# Altium schematic sheet UsFrontEnd.SchDoc
size A3
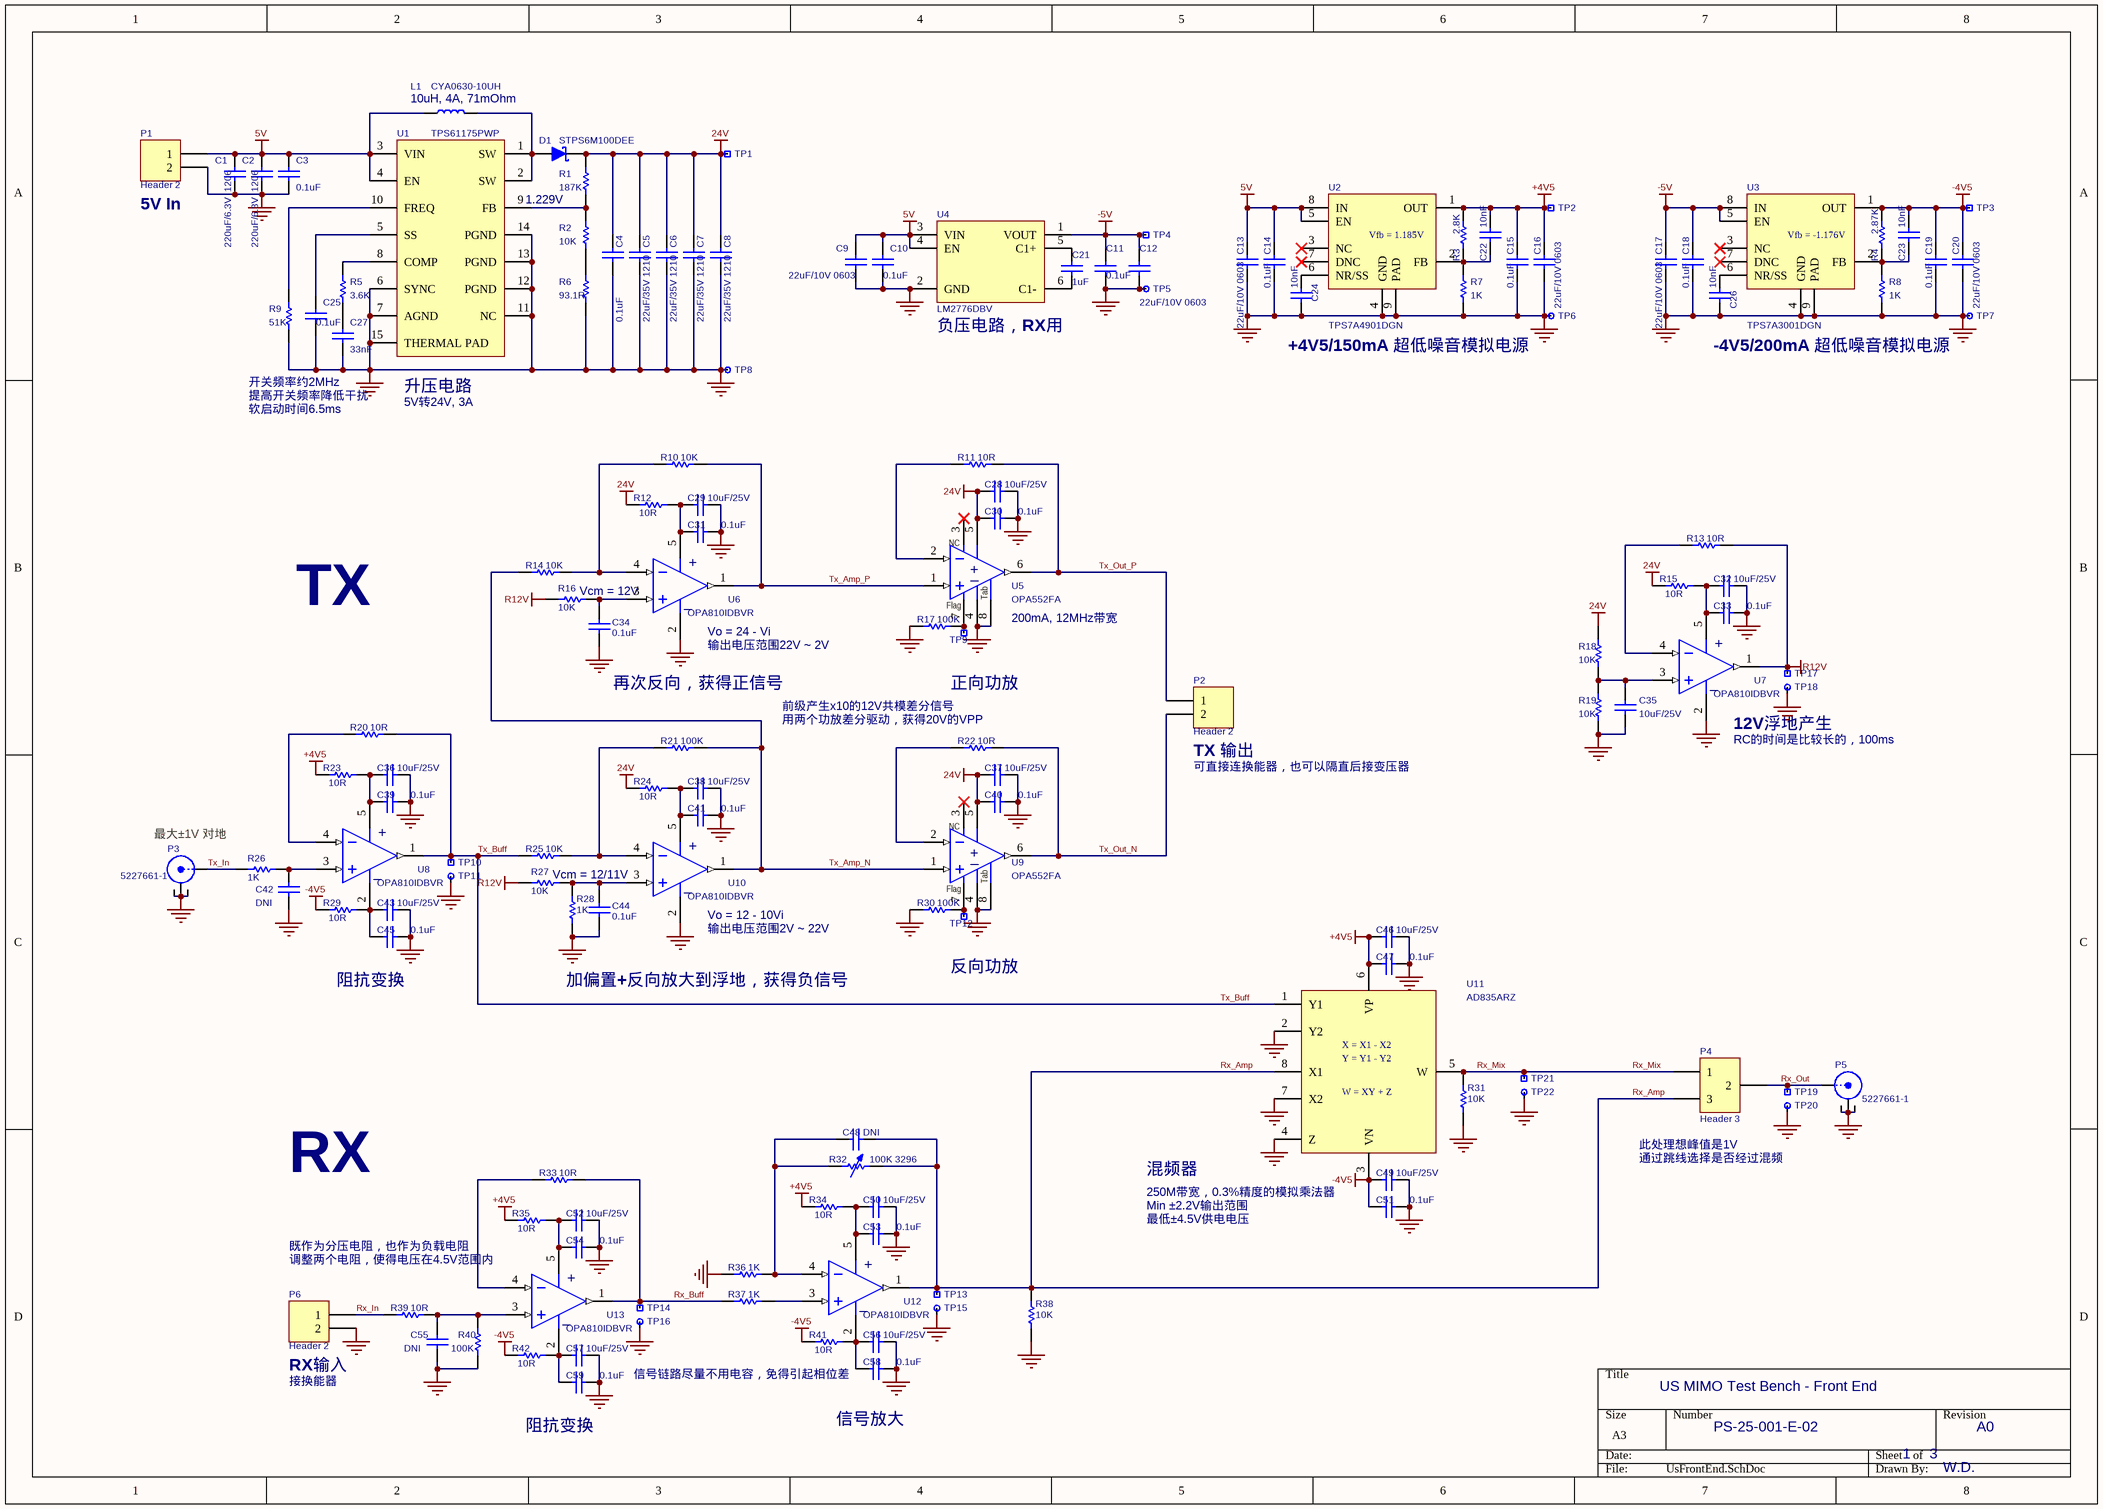
[diagram p0: UsFrontEnd.SchDoc]

## Parts
C1  220uF/6.3V  1206  [1206CAP]
C2  220uF/6.3V  1206  [1206CAP]
C3  0.1uF  [1608[0603]CAP]
C4  0.1uF  [1608[0603]CAP]
C5  22uF/35V 1210  [1210CAP]
C6  22uF/35V 1210  [1210CAP]
C7  22uF/35V 1210  [1210CAP]
C8  22uF/35V 1210  [1210CAP]
C9  22uF/10V 0603  [1608[0603]CAP]
C10  0.1uF  [1005[0402]CAP]
C11  0.1uF  [1005[0402]CAP]
C12  22uF/10V 0603  [1608[0603]CAP]
C13  22uF/10V 0603  [1608[0603]CAP]
C14  0.1uF  [1005[0402]CAP]
C15  0.1uF  [1005[0402]CAP]
C16  22uF/10V 0603  [1608[0603]CAP]
C17  22uF/10V 0603  [1608[0603]CAP]
C18  0.1uF  [1005[0402]CAP]
C19  0.1uF  [1005[0402]CAP]
C20  22uF/10V 0603  [1608[0603]CAP]
C21  1uF  [1005[0402]CAP]
C22  10nF  [1005[0402]CAP]
C23  10nF  [1005[0402]CAP]
C24  10nF  [1005[0402]CAP]
C25  0.1uF  [1608[0603]CAP]
C26  10nF  [1005[0402]CAP]
C27  33nF  [1608[0603]CAP]
C28  10uF/25V  [1608[0603]CAP]
C29  10uF/25V  [1608[0603]CAP]
C30  0.1uF  [1608[0603]CAP]
C31  0.1uF  [1608[0603]CAP]
C32  10uF/25V  [1608[0603]CAP]
C33  0.1uF  [1608[0603]CAP]
C34  0.1uF  [1608[0603]CAP]
C35  10uF/25V  [1608[0603]CAP]
C36  10uF/25V  [1608[0603]CAP]
C37  10uF/25V  [1608[0603]CAP]
C38  10uF/25V  [1608[0603]CAP]
C39  0.1uF  [1608[0603]CAP]
C40  0.1uF  [1608[0603]CAP]
C41  0.1uF  [1608[0603]CAP]
C42  DNI  [1608[0603]CAP]
C43  10uF/25V  [1608[0603]CAP]
C44  0.1uF  [1608[0603]CAP]
C45  0.1uF  [1608[0603]CAP]
C46  10uF/25V  [1608[0603]CAP]
C47  0.1uF  [1608[0603]CAP]
C48  DNI  [1608[0603]CAP]
C49  10uF/25V  [1608[0603]CAP]
C50  10uF/25V  [1608[0603]CAP]
C51  0.1uF  [1608[0603]CAP]
C52  10uF/25V  [1608[0603]CAP]
C53  0.1uF  [1608[0603]CAP]
C54  0.1uF  [1608[0603]CAP]
C55  DNI  [1608[0603]CAP]
C56  10uF/25V  [1608[0603]CAP]
C57  10uF/25V  [1608[0603]CAP]
C58  0.1uF  [1608[0603]CAP]
C59  0.1uF  [1608[0603]CAP]
D1  STPS6M100DEE  [STPS6M100DEE]
L1  CYA0630-10UH  [L6.6X7.2]
P1  Header 2  [KEF2510_2P]
P2  Header 2  [USTR_16MM_H]
P3  5227661-1  [BNC_5227661-1]
P4  Header 3  [HDR1X3]
P5  5227661-1  [BNC_5227661-1]
P6  Header 2  [USTR_16MM_H]
R1  187K  [1608[0603]RES]
R2  10K  [1608[0603]RES]
R3  2.8K  [1005[0402]RES]
R4  2.87K  [1005[0402]RES]
R5  3.6K  [1608[0603]RES]
R6  93.1R  [1608[0603]RES]
R7  1K  [1005[0402]RES]
R8  1K  [1005[0402]RES]
R9  51K  [1608[0603]RES]
R10  10K  [1608[0603]RES]
R11  10R  [1608[0603]RES]
R12  10R  [1608[0603]RES]
R13  10R  [1608[0603]RES]
R14  10K  [1608[0603]RES]
R15  10R  [1608[0603]RES]
R16  10K  [1608[0603]RES]
R17  100K  [1608[0603]RES]
R18  10K  [1608[0603]RES]
R19  10K  [1608[0603]RES]
R20  10R  [1608[0603]RES]
R21  100K  [1608[0603]RES]
R22  10R  [1608[0603]RES]
R23  10R  [1608[0603]RES]
R24  10R  [1608[0603]RES]
R25  10K  [1608[0603]RES]
R26  1K  [1608[0603]RES]
R27  10K  [1608[0603]RES]
R28  1K  [1608[0603]RES]
R29  10R  [1608[0603]RES]
R30  100K  [1608[0603]RES]
R31  10K  [1608[0603]RES]
R32  100K 3296  [3296]
R33  10R  [1608[0603]RES]
R34  10R  [1608[0603]RES]
R35  10R  [1608[0603]RES]
R36  1K  [1608[0603]RES]
R37  1K  [1608[0603]RES]
R38  10K  [1608[0603]RES]
R39  10R  [1608[0603]RES]
R40  100K  [1608[0603]RES]
R41  10R  [1608[0603]RES]
R42  10R  [1608[0603]RES]
TP1  TP_P  [tpad_020_REC]  (value not drawn)
TP2  TP_P  [tpad_020_REC]  (value not drawn)
TP3  TP_P  [tpad_020_REC]  (value not drawn)
TP4  TP_P  [tpad_020_REC]  (value not drawn)
TP5  TP_N  [tpad_020]  (value not drawn)
TP6  TP_N  [tpad_020]  (value not drawn)
TP7  TP_N  [tpad_020]  (value not drawn)
TP8  TP_N  [tpad_020]  (value not drawn)
TP9  TP_P  [tpad_020_REC]  (value not drawn)
TP10  TP_P  [tpad_020_REC]  (value not drawn)
TP11  TP_N  [tpad_020]  (value not drawn)
TP12  TP_P  [tpad_020_REC]  (value not drawn)
TP13  TP_P  [tpad_020_REC]  (value not drawn)
TP14  TP_P  [tpad_020_REC]  (value not drawn)
TP15  TP_N  [tpad_020]  (value not drawn)
TP16  TP_N  [tpad_020]  (value not drawn)
TP17  TP_P  [tpad_020_REC]  (value not drawn)
TP18  TP_N  [tpad_020]  (value not drawn)
TP19  TP_P  [tpad_020_REC]  (value not drawn)
TP20  TP_N  [tpad_020]  (value not drawn)
TP21  TP_P  [tpad_020_REC]  (value not drawn)
TP22  TP_N  [tpad_020]  (value not drawn)
U1  TPS61175PWP  [TSSOP14_PAD]
U2  TPS7A4901DGN  [HVSSOP8]
U3  TPS7A3001DGN  [HVSSOP8]
U4  LM2776DBV  [SOT23-6]
U5  OPA552FA  [TO-263-7]
U6  OPA810IDBVR  [SOT23-5]
U7  OPA810IDBVR  [SOT23-5]
U8  OPA810IDBVR  [SOT23-5]
U9  OPA552FA  [TO-263-7]
U10  OPA810IDBVR  [SOT23-5]
U11  AD835ARZ  [SO8]
U12  OPA810IDBVR  [SOT23-5]
U13  OPA810IDBVR  [SOT23-5]

## Nets
5V: C1.2 C2.2 C3.1 C9.1 C10.2 C13.1 C14.2 L1.1 P1.1 U1.3(VIN) U1.4(EN) U2.5(EN) U2.8(IN) U4.3(VIN) U4.4(EN)
24V: C4.1 C5.2 C6.2 C7.2 C8.2 C28.1 C30.2 C37.1 C40.2 D1.2(K) R1.2 R12.1 R15.1 R18.2 R24.1 TP1.1(A2) U5.5(V+) U9.5(V+)
+4V5: C15.2 C16.1 C22.2 C46.1 C47.2 R3.2 R23.1 R34.1 R35.1 TP2.1(A2) U2.1(OUT) U11.6(VP)
-4V5: C19.2 C20.1 C23.2 C49.1 C51.2 R4.2 R29.1 R41.1 R42.1 TP3.1(A2) U3.1(OUT) U11.3(VN)
-5V: C11.2 C12.1 C17.1 C18.2 TP4.1(A2) U3.5(EN) U3.8(IN) U4.1(VOUT)
GND: C1.1 C2.1 C3.2 C4.2 C5.1 C6.1 C7.1 C8.1 C9.2 C10.1 C11.1 C12.2 C13.2 C14.1 C15.1 C16.2 C17.2 C18.1 C19.1 C20.2 C24.1 C25.1 C26.1 C27.1 C28.2 C29.2 C30.1 C31.1 C32.2 C33.1 C34.2 C35.1 C36.2 C37.2 C38.2 C39.1 C40.1 C41.1 C42.1 C43.2 C44.2 C45.1 C46.2 C47.1 C49.2 C50.2 C51.1 C52.2 C53.1 C54.1 C55.2 C56.2 C57.2 C58.1 C59.1 P1.2 P3.2(Y) P3.3(Y) P3.4(Y) P5.2(Y) P5.3(Y) P5.4(Y) P6.2 R6.1 R7.1 R8.1 R9.1 R17.2 R19.1 R28.2 R30.2 R31.2 R36.1 R38.2 R40.2 TP5.1(A2) TP6.1(A2) TP7.1(A2) TP8.1(A2) TP11.1(A2) TP15.1(A2) TP16.1(A2) TP18.1(A2) TP20.1(A2) TP22.1(A2) U1.6(SYNC) U1.7(AGND) U1.11(NC) U1.12(PGND) U1.13(PGND) U1.14(PGND) U1.15(THERMAL_PAD) U2.4(GND) U2.9(PAD) U3.4(GND) U3.9(PAD) U4.2(GND) U5.4(V-) U5.8(V-) U6.2(V-) U7.2(V-) U9.4(V-) U9.8(V-) U10.2(V-) U11.2(Y2) U11.4(Z) U11.7(X2)
R12V: R13.1 R16.2 R27.2 TP17.1(A2) U7.1(OUT_A)
Rx_Amp: C48.2 P4.3 R32.2 R38.1 TP13.1(A2) U11.8(X1) U12.1(OUT_A)
Rx_Buff: R33.1 R37.2 TP14.1(A2) U13.1(OUT_A)
Rx_In: P6.1 R39.2
Rx_Mix: P4.1 R31.1 TP21.1(A2) U11.5(W)
Rx_Out: P4.2 P5.1(X) TP19.1(A2)
Tx_Amp_N: R14.2 R21.1 U9.1(IN+) U10.1(OUT_A)
Tx_Amp_P: R10.1 U5.1(IN+) U6.1(OUT_A)
Tx_Buff: R20.1 R25.2 TP10.1(A2) U8.1(OUT_A) U11.1(Y1)
Tx_In: P3.1(X) R26.1
Tx_Out_N: P2.2 R22.1 U9.6(OUT_A)
Tx_Out_P: P2.1 R11.1 U5.6(OUT_A)
NetC21_1: C21.1 U4.6(C1-)
NetC21_2: C21.2 U4.5(C1+)
NetC22_1: C22.1 R3.1 R7.2 U2.2(FB)
NetC23_1: C23.1 R4.1 R8.2 U3.2(FB)
NetC24_2: C24.2 U2.6(NR/SS)
NetC25_2: C25.2 U1.5(SS)
NetC26_2: C26.2 U3.6(NR/SS)
NetC27_2: C27.2 R5.1
NetC29_1: C29.1 C31.2 R12.2 U6.5(V+)
NetC32_1: C32.1 C33.2 R15.2 U7.5(V+)
NetC34_1: C34.1 R16.1 U6.3(IN+)
NetC35_2: C35.2 R18.1 R19.2 U7.3(IN+)
NetC36_1: C36.1 C39.2 R23.2 U8.5(V+)
NetC38_1: C38.1 C41.2 R24.2 U10.5(V+)
NetC42_2: C42.2 R26.2 U8.3(IN+)
NetC43_1: C43.1 C45.2 R29.2 U8.2(V-)
NetC44_1: C44.1 R27.1 R28.1 U10.3(IN+)
NetC48_1: C48.1 R32.1 R36.2 U12.4(IN-)
NetC50_1: C50.1 C53.2 R34.2 U12.5(V+)
NetC52_1: C52.1 C54.2 R35.2 U13.5(V+)
NetC55_1: C55.1 R39.1 R40.1 U13.3(IN+)
NetC56_1: C56.1 C58.2 R41.2 U12.2(V-)
NetC57_1: C57.1 C59.2 R42.2 U13.2(V-)
NetD1_1: D1.1(A) L1.2 U1.1(SW) U1.2(SW)
NetR1_1: R1.1 R2.2 U1.9(FB)
NetR2_1: R2.1 R6.2
NetR5_2: R5.2 U1.8(COMP)
NetR9_2: R9.2 U1.10(FREQ)
NetR10_2: R10.2 R14.1 U6.4(IN-)
NetR11_2: R11.2 U5.2(IN-)
NetR13_2: R13.2 U7.4(IN-)
NetR17_1: R17.1 TP9.1(A2) U5.7(V-)
NetR20_2: R20.2 U8.4(IN-)
NetR21_2: R21.2 R25.1 U10.4(IN-)
NetR22_2: R22.2 U9.2(IN-)
NetR30_1: R30.1 TP12.1(A2) U9.7(V-)
NetR33_2: R33.2 U13.4(IN-)
NetR37_1: R37.1 U12.3(IN+)

Not connected (* = marked no-connect by the designer): U2 3(NC)* 7(DNC)*; U3 3(NC)* 7(DNC)*; U5 3(V-)*; U9 3(V-)*

## Notes on the sheet
- (near L1) 10uH, 4A, 71mOhm
- (near P1) 5V In
- 1.229V
- (near U4) 负压电路，RX用
- +4V5/150mA 超低噪音模拟电源
- -4V5/200mA 超低噪音模拟电源
- 开关频率约2MHz
- 提高开关频率降低干扰
- 软启动时间6.5ms
- 5V转24V, 3A
- (near U1) 升压电路
- TX
- (near R16) Vcm = 12V
- (near U6) Vo = 24 - Vi
- (near U6) 输出电压范围22V ~ 2V
- (near U5) 200mA, 12MHz带宽
- 再次反向，获得正信号
- 前级产生x10的12V共模差分信号
- 用两个功放差分驱动，获得20V的VPP
- 正向功放
- (near P2) TX 输出
- (near P2) 可直接连换能器，也可以隔直后接变压器
- 12V浮地产生
- RC的时间是比较长的，100ms
- (near P3) 最大±1V 对地
- (near R27) Vcm = 12/11V
- (near U10) Vo = 12 - 10Vi
- (near C45) 阻抗变换
- 加偏置+反向放大到浮地，获得负信号
- (near U10) 输出电压范围2V ~ 22V
- 反向功放
- RX
- 混频器
- (near P4) 此处理想峰值是1V
- 通过跳线选择是否经过混频
- 调整两个电阻，使得电压在4.5V范围内
- 既作为分压电阻，也作为负载电阻
- (near U11) 250M带宽，0.3%精度的模拟乘法器
- Min ±2.2V输出范围
- 最低±4.5V供电电压
- (near P6) RX输入
- (near P6) 接换能器
- 信号链路尽量不用电容，免得引起相位差
- US MIMO Test Bench - Front End
- (near C59) 阻抗变换
- (near C58) 信号放大
- PS-25-001-E-02
- 1
- 3
- A0
- W.D.
- (in symbol AD835ARZ) X = X1 - X2; Y = Y1 - Y2; W = XY + Z
- (in symbol LM7321MF) +; _
- (in symbol OPA552FA) NC; +; _; Tab; Flag
- (in symbol TPS7A3001DGN) Vfb = -1.176V
- (in symbol TPS7A4901DGN) Vfb = 1.185V

## Library data of the parts
C1-C59 = Cap: Capacitor; Published: 8-Jun-2000; LatestRevisionDate: 17-Jul-2002; LatestRevisionNote: Re-released for DXP Platform.; PackageReference: RAD-0.3; Publisher: Altium Limited; PackageDescription: Radial Cap, Thru-Hole; 2 Leads; 0.3 in Pin Spacing
D1 = D Schottky_S: Zener Diode; Published: 8-Jun-2000; LatestRevisionDate: 17-Jul-2002; LatestRevisionNote: Re-released for DXP Platform.; PackageReference: DIODE-0.7; Publisher: Altium Limited; PackageDescription: Diode, Thru-Hole; 2 Leads; 0.7 in Pin Spacing
L1 = Inductor_S: Inductor; Code_IEC: 1005; Published: 8-Jun-2000; LatestRevisionDate: 29-May-2009; LatestRevisionNote: IPC-7351 Footprint Added.; PackageReference: 0402-A; Publisher: Altium Limited; PackageDescription: Chip Inductor; Code_JEITA: 0402
P1 P2 P6 = Header 2: Header, 2-Pin; LatestRevisionDate: 17-Jul-2002; LatestRevisionNote: Re-released for DXP Platform.; Publisher: Altium Limited
P3 P5 = BNC_TE: BNC Elbow Connector; LatestRevisionDate: 17-Jul-2002; LatestRevisionNote: Re-released for DXP Platform.; Publisher: Altium Limited
P4 = Header 3: Header, 3-Pin; LatestRevisionDate: 17-Jul-2002; LatestRevisionNote: Re-released for DXP Platform.; Publisher: Altium Limited
R1-R31 R33-R42 = Res1: Resistor; Published: 8-Jun-2000; LatestRevisionDate: 17-Jul-2002; LatestRevisionNote: Re-released for DXP Platform.; PackageReference: AXIAL-0.3; Publisher: Altium Limited; PackageDescription: Axial Device, Thru-Hole; 2 Leads; 0.3 in Pin Spacing
R32 = Res Adj1: Variable Resistor; Set Position: 0.5; Published: 8-Jun-2000; LatestRevisionDate: 17-Jul-2002; LatestRevisionNote: Re-released for DXP Platform.; PackageReference: AXIAL-0.7; Publisher: Altium Limited; PackageDescription: Axial Device, Thru-Hole; 2 Leads; 0.7 in Pin Spacing
U1 = TPS61175
U4 = LM2776
U6-U8 U10 U12 U13 = LM7321MF: Op Amp